# Altium project CH340G.PrjPcb
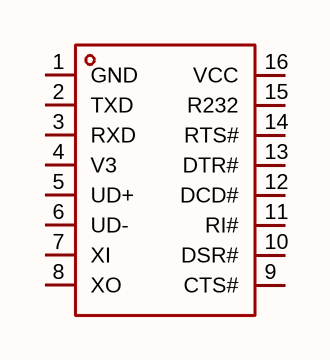
[diagram p0: CH340G.schdoc]
1 sheet, 1 parts. Net scope: global (net labels, ports and power ports of the same name join across sheets).

## Sheet CH340G.schdoc
size 127 x 101 mm

### Parts
U?  ch340g  [SOIC-16_L9.9-W3.9-P1.27-LS6.0-BL]  (value not drawn)

### Nets

Not connected (* = marked no-connect by the designer): U? 1(GND) 2(TXD) 3(RXD) 4(V3) 5(UD+) 6(UD-) 7(XI) 8(XO) 9(CTS#) 10(DSR#) 11(RI#) 12(DCD#) 13(DTR#) 14(RTS#) 15(R232) 16(VCC)

### Library data of the parts
U? = ch340g: 应用功能:USB转UART;USB协议版本:USB 2.0;数据速率:2Mbps;; Manufacturer: WCH(南京沁恒); AddInBom: yes; ModelId: c21ec766ec2643efb3352f8441994f4e; ModelName: SOIC-16_L9.9-W3.9-H1.8-LS6.0-P1.27; ModelTransform: 389.763,236.454,0,0,0,0,0,0,0; USB Protocol: USB 2.0; Voltage - Supply: 5V；3.3V; Data Rate: 2Mbps; Symbol: CH340G; LCSC Part Name: USB转串口芯片CH340; SupplierPart: C14267; ManufacturerPart: CH340G; Supplier Footprint: SOP-16; JLCPCB Part Class: Extended Part; Datasheet: https://item.szlcsc.com/datasheet/CH340G/14927.html; Supplier: LCSC; ConvertToPcb: yes; FootprintName: SOIC-16_L9.9-W3.9-P1.27-LS6.0-BL; Applications Function: USB转UART; Operating Temperature: -40℃~+85℃; Features: 可编程波特率；内置时钟发生器；上电复位